# Altium schematic sheet DIO_8SMA_8MCX_MEZZ.SchDoc: =DocumentName
size A4; DocumentNumber: 1; Revision: 0; SheetNumber: 1; SheetTotal: 6
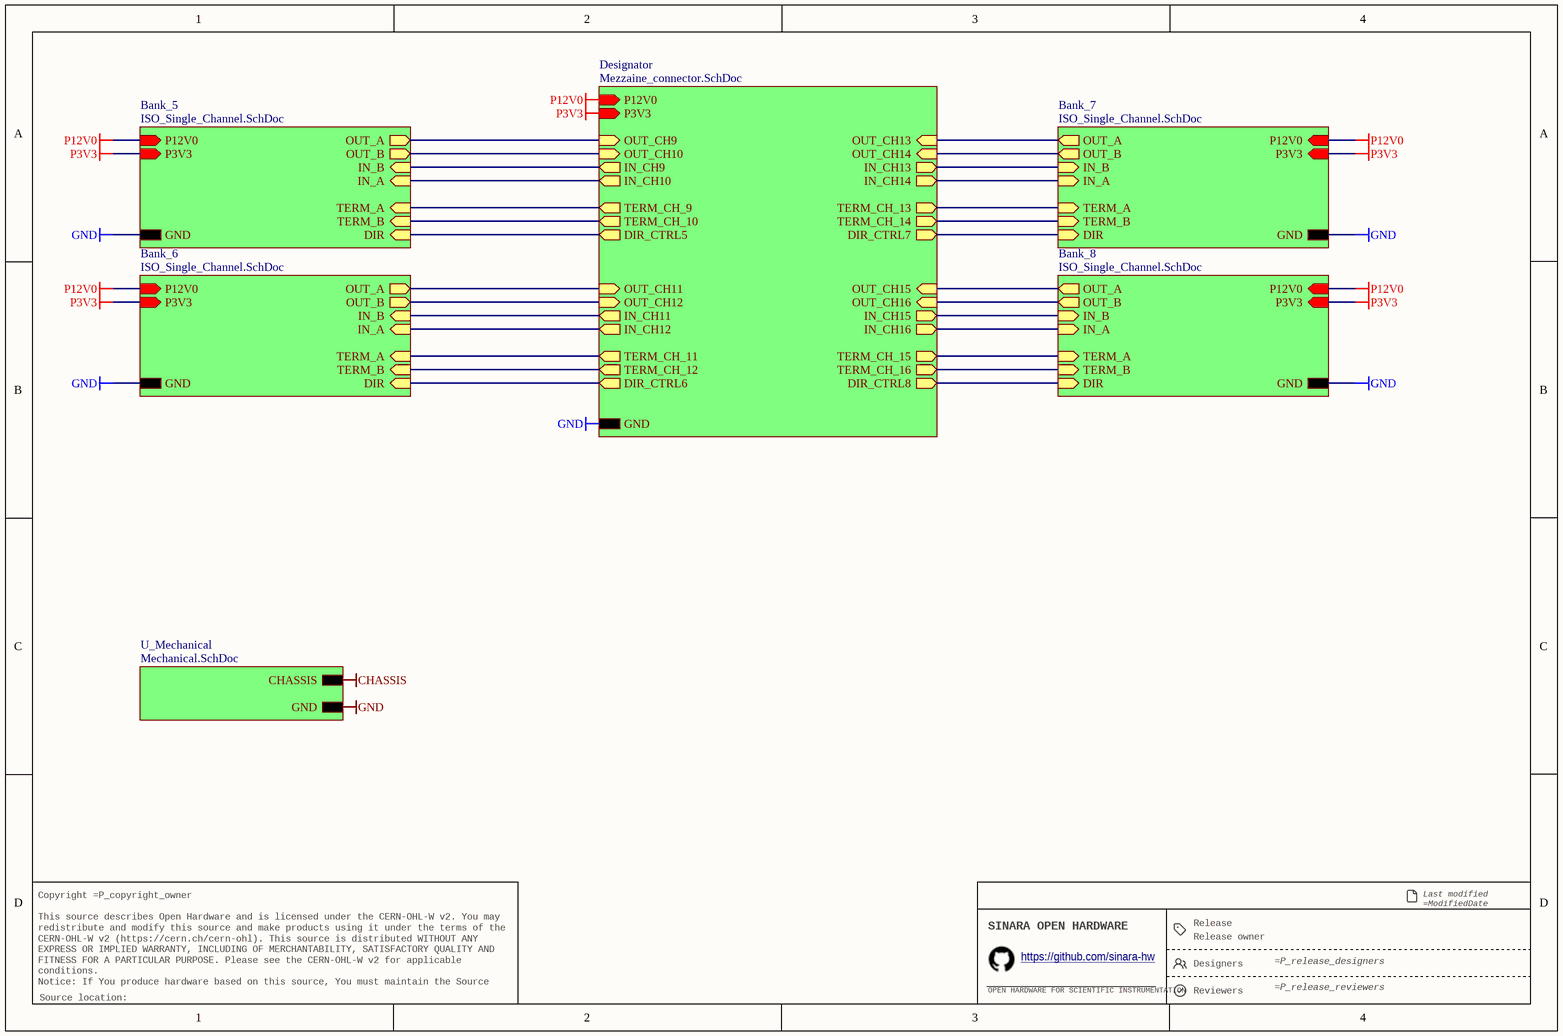
[diagram p0: DIO_8SMA_8MCX_MEZZ.SchDoc]

## Sub-sheets
Bank_5 = ISO_Single_Channel.SchDoc: P12V0 (in), GND, OUT_A (out), OUT_B (out), IN_B (in), IN_A (in), TERM_A (in), DIR (in), TERM_B (in), P3V3 (in)
Bank_6 = ISO_Single_Channel.SchDoc: P12V0 (in), GND, OUT_A (out), OUT_B (out), IN_B (in), IN_A (in), TERM_A (in), DIR (in), TERM_B (in), P3V3 (in)
Bank_7 = ISO_Single_Channel.SchDoc: P12V0 (in), GND, OUT_A (out), OUT_B (out), IN_B (in), IN_A (in), TERM_A (in), DIR (in), TERM_B (in), P3V3 (in)
Bank_8 = ISO_Single_Channel.SchDoc: P12V0 (in), GND, OUT_A (out), OUT_B (out), IN_B (in), IN_A (in), TERM_A (in), DIR (in), TERM_B (in), P3V3 (in)
Designator = Mezzaine_connector.SchDoc: P12V0 (in), P3V3 (in), GND, OUT_CH9 (in), IN_CH9 (out), TERM_CH_9 (out), DIR_CTRL5 (out), OUT_CH10 (in), IN_CH10 (out), TERM_CH_10 (out), OUT_CH13 (in), OUT_CH14 (in), IN_CH13 (out), IN_CH14 (out), TERM_CH_13 (out), TERM_CH_14 (out), DIR_CTRL7 (out), DIR_CTRL6 (out), TERM_CH_12 (out), TERM_CH_11 (out), IN_CH12 (out), IN_CH11 (out), OUT_CH12 (in), OUT_CH11 (in), DIR_CTRL8 (out), TERM_CH_16 (out), TERM_CH_15 (out), IN_CH16 (out), IN_CH15 (out), OUT_CH16 (in), OUT_CH15 (in)
U_Mechanical = Mechanical.SchDoc: CHASSIS, GND

## Nets
CHASSIS: sheet U_Mechanical/CHASSIS
GND: sheet Bank_5/GND, sheet Bank_6/GND, sheet Bank_7/GND, sheet Bank_8/GND, sheet U_Mechanical/GND, sheet Designator/GND
P3V3: sheet Bank_5/P3V3, sheet Bank_6/P3V3, sheet Bank_7/P3V3, sheet Bank_8/P3V3, sheet Designator/P3V3
P12V0: sheet Bank_5/P12V0, sheet Bank_6/P12V0, sheet Bank_7/P12V0, sheet Bank_8/P12V0, sheet Designator/P12V0
(unnamed): sheet Bank_5/OUT_A, sheet Designator/OUT_CH9
(unnamed): sheet Bank_5/OUT_B, sheet Designator/OUT_CH10
(unnamed): sheet Bank_5/IN_B, sheet Designator/IN_CH9
(unnamed): sheet Bank_5/IN_A, sheet Designator/IN_CH10
(unnamed): sheet Bank_5/TERM_A, sheet Designator/TERM_CH_9
(unnamed): sheet Bank_5/DIR, sheet Designator/DIR_CTRL5
(unnamed): sheet Bank_5/TERM_B, sheet Designator/TERM_CH_10
(unnamed): sheet Bank_6/OUT_A, sheet Designator/OUT_CH11
(unnamed): sheet Bank_6/OUT_B, sheet Designator/OUT_CH12
(unnamed): sheet Bank_6/IN_B, sheet Designator/IN_CH11
(unnamed): sheet Bank_6/IN_A, sheet Designator/IN_CH12
(unnamed): sheet Bank_6/TERM_A, sheet Designator/TERM_CH_11
(unnamed): sheet Bank_6/DIR, sheet Designator/DIR_CTRL6
(unnamed): sheet Bank_6/TERM_B, sheet Designator/TERM_CH_12
(unnamed): sheet Bank_7/OUT_A, sheet Designator/OUT_CH13
(unnamed): sheet Bank_7/OUT_B, sheet Designator/OUT_CH14
(unnamed): sheet Bank_7/IN_B, sheet Designator/IN_CH13
(unnamed): sheet Bank_7/IN_A, sheet Designator/IN_CH14
(unnamed): sheet Bank_7/TERM_A, sheet Designator/TERM_CH_13
(unnamed): sheet Bank_7/DIR, sheet Designator/DIR_CTRL7
(unnamed): sheet Bank_7/TERM_B, sheet Designator/TERM_CH_14
(unnamed): sheet Bank_8/OUT_A, sheet Designator/OUT_CH15
(unnamed): sheet Bank_8/OUT_B, sheet Designator/OUT_CH16
(unnamed): sheet Bank_8/IN_B, sheet Designator/IN_CH15
(unnamed): sheet Bank_8/IN_A, sheet Designator/IN_CH16
(unnamed): sheet Bank_8/TERM_A, sheet Designator/TERM_CH_15
(unnamed): sheet Bank_8/DIR, sheet Designator/DIR_CTRL8
(unnamed): sheet Bank_8/TERM_B, sheet Designator/TERM_CH_16

## Notes on the sheet
- Release
- Last modified =ModifiedDate
  Sheet =sheetnumber of =sheettotal · Size A4
- Copyright =P_copyright_owner
  This source describes Open Hardware and is licensed under the CERN-OHL-W v2. You may redistribute and modify this source and make products using it under the terms of the CERN-OHL-W v2 (https://cern.ch/cern-ohl). This source is distributed WITHOUT ANY EXPRESS OR IMPLIED WARRANTY, INCLUDING OF MERCHANTABILITY, SATISFACTORY QUALITY AND FITNESS FOR A PARTICULAR PURPOSE. Please see the CERN-OHL-W v2 for applicable conditions.
  Notice: If You produce hardware based on this source, You must maintain the Source Location visible on the product, its packaging or its documentation.
- SINARA OPEN HARDWARE
- OPEN HARDWARE FOR SCIENTIFIC INSTRUMENTATION
- https://github.com/sinara-hw
- Release owner
- Designers
- Reviewers
- Source location: